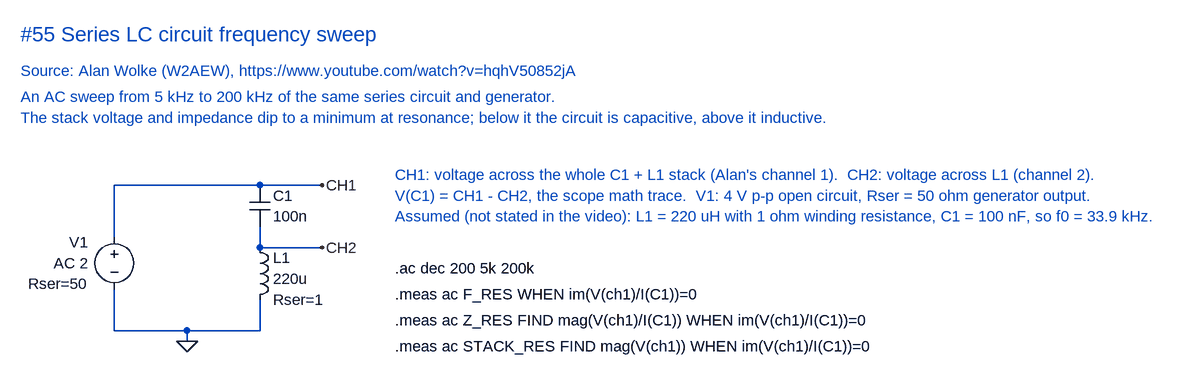
[diagram p0: schematic Series LC frequency sweep.asc]
Series LC frequency sweep.asc, the LTspice schematic file:
Version 4.1
SHEET 1 1400 700
WIRE 48 32 272 32
WIRE 272 32 368 32
WIRE 48 32 48 112
WIRE 272 96 272 128
WIRE 272 128 368 128
WIRE 272 208 272 256
WIRE 48 192 48 256
WIRE 48 256 160 256
WIRE 160 256 272 256
WIRE 160 256 160 272
FLAG 160 272 0
FLAG 368 32 CH1
FLAG 368 128 CH2
SYMBOL voltage 48 96 R0
WINDOW 0 -40 24 Right 2
WINDOW 3 -40 56 Right 2
WINDOW 123 0 0 Left 0
WINDOW 39 -40 88 Right 2
SYMATTR InstName V1
SYMATTR Value AC 2
SYMATTR SpiceLine Rser=50
SYMBOL cap 256 32 R0
WINDOW 0 36 16 Left 2
WINDOW 3 36 48 Left 2
SYMATTR InstName C1
SYMATTR Value 100n
SYMBOL ind 256 112 R0
WINDOW 0 36 32 Left 2
WINDOW 3 36 64 Left 2
WINDOW 39 36 96 Left 2
SYMATTR InstName L1
SYMATTR Value 220u
SYMATTR SpiceLine Rser=1
TEXT -96 -200 Left 3 ;#55 Series LC circuit frequency sweep
TEXT -96 -144 Left 2 ;Source: Alan Wolke (W2AEW), https://www.youtube.com/watch?v=hqhV50852jA
TEXT -96 -104 Left 2 ;An AC sweep from 5 kHz to 200 kHz of the same series circuit and generator.
TEXT -96 -72 Left 2 ;The stack voltage and impedance dip to a minimum at resonance; below it the circuit is capacitive, above it inductive.
TEXT 480 16 Left 2 ;CH1: voltage across the whole C1 + L1 stack (Alan's channel 1).  CH2: voltage across L1 (channel 2).
TEXT 480 48 Left 2 ;V(C1) = CH1 - CH2, the scope math trace.  V1: 4 V p-p open circuit, Rser = 50 ohm generator output.
TEXT 480 80 Left 2 ;Assumed (not stated in the video): L1 = 220 uH with 1 ohm winding resistance, C1 = 100 nF, so f0 = 33.9 kHz.
TEXT 480 160 Left 2 !.ac dec 200 5k 200k
TEXT 480 200 Left 2 !.meas ac F_RES WHEN im(V(ch1)/I(C1))=0
TEXT 480 240 Left 2 !.meas ac Z_RES FIND mag(V(ch1)/I(C1)) WHEN im(V(ch1)/I(C1))=0
TEXT 480 280 Left 2 !.meas ac STACK_RES FIND mag(V(ch1)) WHEN im(V(ch1)/I(C1))=0

The netlist it stands for:
* Series LC frequency sweep.asc
V1 CH1 0 AC 2 Rser=50
C1 CH1 CH2 100n
L1 CH2 0 220u Rser=1
* #55 Series LC circuit frequency sweep
* Source: Alan Wolke (W2AEW), https://www.youtube.com/watch?v=hqhV50852jA
* An AC sweep from 5 kHz to 200 kHz of the same series circuit and generator.
* The stack voltage and impedance dip to a minimum at resonance; below it the circuit is capacitive, above it inductive.
* CH1: voltage across the whole C1 + L1 stack (Alan's channel 1).  CH2: voltage across L1 (channel 2).
* V(C1) = CH1 - CH2, the scope math trace.  V1: 4 V p-p open circuit, Rser = 50 ohm generator output.
* Assumed (not stated in the video): L1 = 220 uH with 1 ohm winding resistance, C1 = 100 nF, so f0 = 33.9 kHz.
.ac dec 200 5k 200k
.meas ac F_RES WHEN im(V(ch1)/I(C1))=0
.meas ac Z_RES FIND mag(V(ch1)/I(C1)) WHEN im(V(ch1)/I(C1))=0
.meas ac STACK_RES FIND mag(V(ch1)) WHEN im(V(ch1)/I(C1))=0
.backanno
.end